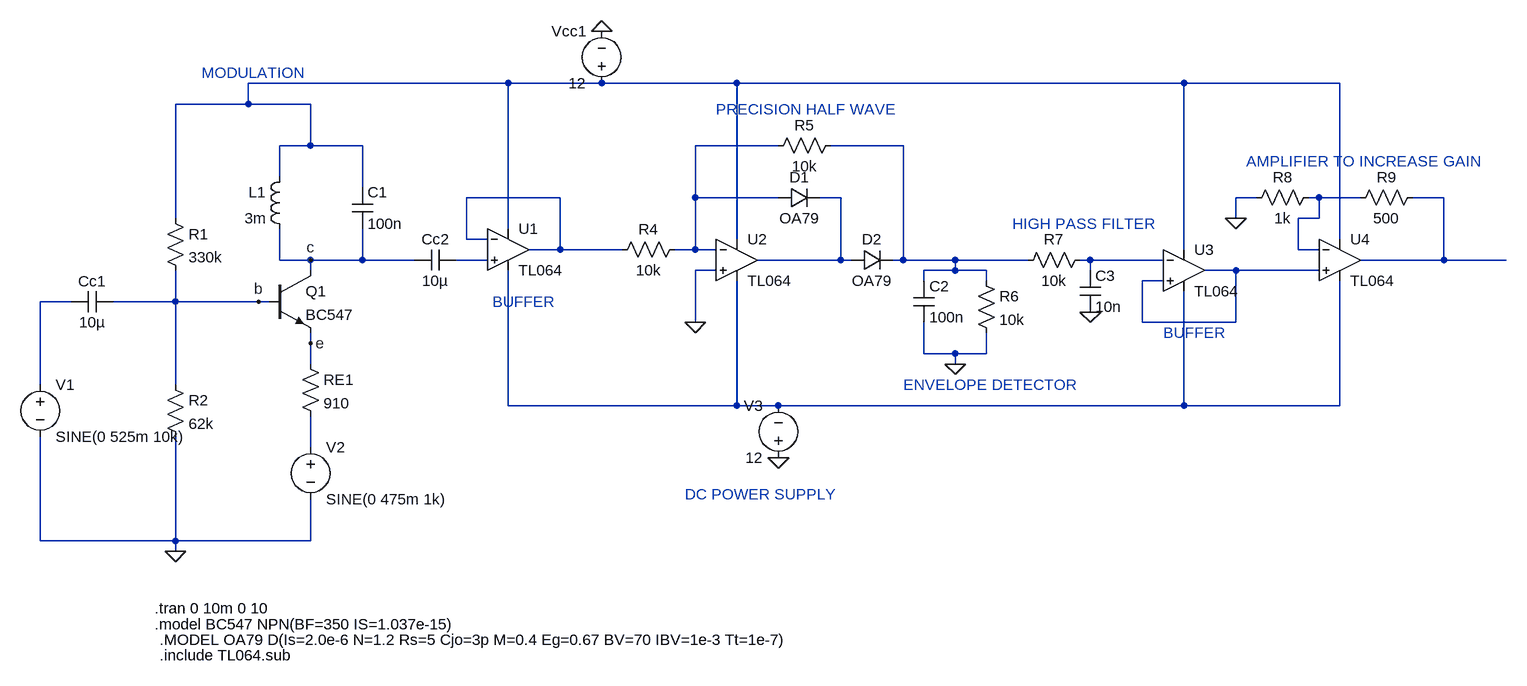
[diagram p0: schematic De_modulation.asc]
De_modulation.asc, the LTspice schematic file:
Version 4
SHEET 1 1332 680
WIRE -480 -800 -880 -800
WIRE -336 -800 -480 -800
WIRE -128 -800 -336 -800
WIRE 560 -800 -128 -800
WIRE 800 -800 560 -800
WIRE -880 -768 -880 -800
WIRE -880 -768 -992 -768
WIRE -784 -768 -880 -768
WIRE -784 -704 -784 -768
WIRE -784 -704 -832 -704
WIRE -704 -704 -784 -704
WIRE -64 -704 -192 -704
WIRE 128 -704 16 -704
WIRE -832 -656 -832 -704
WIRE -704 -640 -704 -704
WIRE -400 -624 -544 -624
WIRE -192 -624 -192 -704
WIRE -64 -624 -192 -624
WIRE 32 -624 0 -624
WIRE 672 -624 640 -624
WIRE 768 -624 752 -624
WIRE 832 -624 768 -624
WIRE 960 -624 912 -624
WIRE -992 -592 -992 -768
WIRE 640 -592 640 -624
WIRE 768 -592 768 -624
WIRE 768 -592 736 -592
WIRE -480 -576 -480 -800
WIRE -544 -560 -544 -624
WIRE -512 -560 -544 -560
WIRE -128 -560 -128 -800
WIRE 800 -560 800 -800
WIRE -400 -544 -400 -624
WIRE -400 -544 -448 -544
WIRE -304 -544 -400 -544
WIRE -192 -544 -192 -624
WIRE -192 -544 -224 -544
WIRE -160 -544 -192 -544
WIRE 560 -544 560 -800
WIRE 736 -544 736 -592
WIRE 768 -544 736 -544
WIRE -832 -528 -832 -576
WIRE -784 -528 -832 -528
WIRE -704 -528 -704 -576
WIRE -704 -528 -784 -528
WIRE -624 -528 -704 -528
WIRE -512 -528 -560 -528
WIRE 32 -528 32 -624
WIRE 32 -528 -96 -528
WIRE 48 -528 32 -528
WIRE 128 -528 128 -704
WIRE 128 -528 112 -528
WIRE 208 -528 128 -528
WIRE 320 -528 208 -528
WIRE 416 -528 400 -528
WIRE 528 -528 416 -528
WIRE 960 -528 960 -624
WIRE 960 -528 832 -528
WIRE 1056 -528 960 -528
WIRE -784 -512 -784 -528
WIRE -160 -512 -192 -512
WIRE 208 -512 208 -528
WIRE 208 -512 160 -512
WIRE 256 -512 208 -512
WIRE 416 -512 416 -528
WIRE 640 -512 592 -512
WIRE 768 -512 640 -512
WIRE 160 -496 160 -512
WIRE 256 -496 256 -512
WIRE 528 -496 496 -496
WIRE -1152 -464 -1200 -464
WIRE -992 -464 -992 -512
WIRE -992 -464 -1088 -464
WIRE -864 -464 -992 -464
WIRE -848 -464 -864 -464
WIRE -192 -432 -192 -512
WIRE 496 -432 496 -496
WIRE 640 -432 640 -512
WIRE 640 -432 496 -432
WIRE -784 -400 -784 -416
WIRE 160 -384 160 -432
WIRE 208 -384 160 -384
WIRE 256 -384 256 -416
WIRE 256 -384 208 -384
WIRE -784 -368 -784 -400
WIRE 208 -368 208 -384
WIRE -1200 -336 -1200 -464
WIRE -992 -336 -992 -464
WIRE -480 -304 -480 -512
WIRE -128 -304 -128 -496
WIRE -128 -304 -480 -304
WIRE -64 -304 -128 -304
WIRE 560 -304 560 -480
WIRE 560 -304 -64 -304
WIRE 800 -304 800 -496
WIRE 800 -304 560 -304
WIRE -784 -240 -784 -288
WIRE -1200 -96 -1200 -256
WIRE -992 -96 -992 -256
WIRE -992 -96 -1200 -96
WIRE -784 -96 -784 -160
WIRE -784 -96 -992 -96
WIRE -992 -80 -992 -96
FLAG -336 -880 0
FLAG -992 -80 0
FLAG -784 -528 c
FLAG -864 -464 b
FLAG -784 -400 e
FLAG 208 -368 0
FLAG -192 -432 0
FLAG -64 -224 0
FLAG 416 -448 0
FLAG 640 -592 0
SYMBOL ind -816 -672 M0
SYMATTR InstName L1
SYMATTR Value 3m
SYMBOL npn -848 -512 R0
SYMATTR InstName Q1
SYMATTR Value BC547
SYMBOL voltage -336 -784 R180
WINDOW 0 24 96 Left 2
WINDOW 3 24 16 Left 2
WINDOW 123 0 0 Left 0
WINDOW 39 0 0 Left 0
SYMATTR InstName Vcc1
SYMATTR Value 12
SYMBOL res -1008 -608 R0
SYMATTR InstName R1
SYMATTR Value 330k
SYMBOL res -1008 -352 R0
SYMATTR InstName R2
SYMATTR Value 62k
SYMBOL res -800 -384 R0
SYMATTR InstName RE1
SYMATTR Value 910
SYMBOL cap -720 -640 R0
SYMATTR InstName C1
SYMATTR Value 100n
SYMBOL voltage -1200 -352 R0
WINDOW 123 0 0 Left 0
WINDOW 39 0 0 Left 0
SYMATTR InstName V1
SYMATTR Value SINE(0 525m 10k)
SYMBOL voltage -784 -256 R0
WINDOW 123 0 0 Left 0
WINDOW 39 0 0 Left 0
SYMATTR InstName V2
SYMATTR Value SINE(0 475m 1k)
SYMBOL cap -1088 -480 R90
WINDOW 0 0 32 VBottom 2
WINDOW 3 32 32 VTop 2
SYMATTR InstName Cc1
SYMATTR Value 10µ
SYMBOL cap -560 -544 R90
WINDOW 0 0 32 VBottom 2
WINDOW 3 32 32 VTop 2
SYMATTR InstName Cc2
SYMATTR Value 10µ
SYMBOL res 240 -512 R0
SYMATTR InstName R6
SYMATTR Value 10k
SYMBOL cap 144 -496 R0
SYMATTR InstName C2
SYMATTR Value 100n
SYMBOL res -208 -560 R90
WINDOW 0 0 56 VBottom 2
WINDOW 3 32 56 VTop 2
SYMATTR InstName R4
SYMATTR Value 10k
SYMBOL res 32 -720 R90
WINDOW 0 0 56 VBottom 2
WINDOW 3 32 56 VTop 2
SYMATTR InstName R5
SYMATTR Value 10k
SYMBOL diode -64 -608 R270
WINDOW 0 32 32 VTop 2
WINDOW 3 0 32 VBottom 2
SYMATTR InstName D1
SYMATTR Value OA79
SYMBOL diode 48 -512 R270
WINDOW 0 32 32 VTop 2
WINDOW 3 0 32 VBottom 2
SYMATTR InstName D2
SYMATTR Value OA79
SYMBOL voltage -64 -208 R180
WINDOW 0 24 96 Left 2
WINDOW 3 24 16 Left 2
SYMATTR InstName V3
SYMATTR Value 12
SYMBOL res 304 -512 R270
WINDOW 0 32 56 VTop 2
WINDOW 3 0 56 VBottom 2
SYMATTR InstName R7
SYMATTR Value 10k
SYMBOL cap 400 -512 R0
SYMATTR InstName C3
SYMATTR Value 10n
SYMBOL OpAmps\\opamp2 560 -576 R0
SYMATTR InstName U3
SYMATTR Value TL064
SYMBOL OpAmps\\opamp2 -128 -592 R0
SYMATTR InstName U2
SYMATTR Value TL064
SYMBOL OpAmps\\opamp2 800 -592 R0
SYMATTR InstName U4
SYMATTR Value TL064
SYMBOL res 768 -640 R90
WINDOW 0 0 56 VBottom 2
WINDOW 3 32 56 VTop 2
SYMATTR InstName R8
SYMATTR Value 1k
SYMBOL res 928 -640 R90
WINDOW 0 0 56 VBottom 2
WINDOW 3 32 56 VTop 2
SYMATTR InstName R9
SYMATTR Value 500
SYMBOL OpAmps\\opamp2 -480 -608 R0
SYMATTR InstName U1
SYMATTR Value TL064
TEXT -1024 8 Left 2 !.tran 0 10m 0 10
TEXT -1024 32 Left 2 !.model BC547 NPN(BF=350 IS=1.037e-15)
TEXT -1016 56 Left 2 !.MODEL OA79 D(Is=2.0e-6 N=1.2 Rs=5 Cjo=3p M=0.4 Eg=0.67 BV=70 IBV=1e-3 Tt=1e-7)
TEXT -1016 80 Left 2 !.include TL064.sub
TEXT -208 -168 Left 2 ;DC POWER SUPPLY
TEXT -952 -816 Left 2 ;MODULATION
TEXT -504 -464 Left 2 ;BUFFER
TEXT -160 -760 Left 2 ;PRECISION HALF WAVE
TEXT 128 -336 Left 2 ;ENVELOPE DETECTOR
TEXT 296 -584 Left 2 ;HIGH PASS FILTER
TEXT 528 -416 Left 2 ;BUFFER
TEXT 656 -680 Left 2 ;AMPLIFIER TO INCREASE GAIN

The netlist it stands for:
* De_modulation.asc
L1 N001 c 3m
Q1 c b e 0 BC547
Vcc1 N001 0 12
R1 N001 b 330k
R2 b 0 62k
RE1 e N013 910
C1 N001 c 100n
V1 N011 0 SINE(0 525m 10k)
V2 N013 0 SINE(0 475m 1k)
Cc1 b N011 10µ
Cc2 N008 c 10µ
R6 N003 0 10k
C2 N003 0 100n
R4 N002 N004 10k
R5 N003 N002 10k
D1 N002 N005 OA79
D2 N005 N003 OA79
V3 0 N012 12
R7 N003 N009 10k
C3 N009 0 10n
XU3 N010 N009 N001 N012 N010 TL064  ; pins In+ In- V+ V- OUT
XU2 0 N002 N001 N012 N005 TL064  ; pins In+ In- V+ V- OUT
XU4 N010 N006 N001 N012 N007 TL064  ; pins In+ In- V+ V- OUT
R8 N006 0 1k
R9 N007 N006 500
XU1 N008 N004 N001 N012 N004 TL064  ; pins In+ In- V+ V- OUT
.model D D
.lib standard.dio
.model NPN NPN
.model PNP PNP
.lib standard.bjt
.tran 0 10m 0 10
.model BC547 NPN(BF=350 IS=1.037e-15)
.MODEL OA79 D(Is=2.0e-6 N=1.2 Rs=5 Cjo=3p M=0.4 Eg=0.67 BV=70 IBV=1e-3 Tt=1e-7)
.include TL064.sub
* DC POWER SUPPLY
* MODULATION
* BUFFER
* PRECISION HALF WAVE
* ENVELOPE DETECTOR
* HIGH PASS FILTER
* BUFFER
* AMPLIFIER TO INCREASE GAIN
.backanno
.end